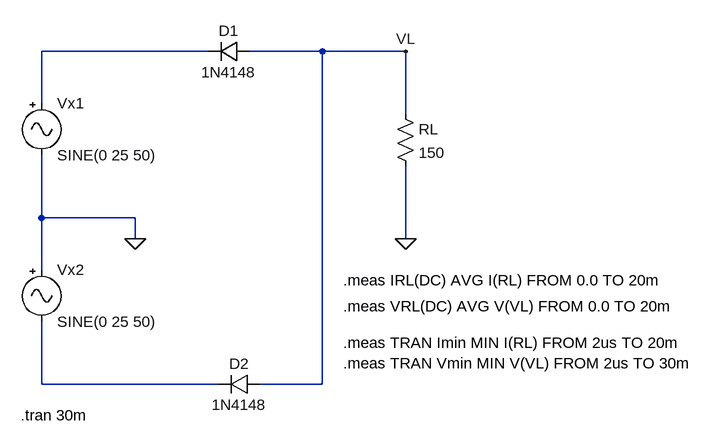
[diagram p0: schematic EXP1.4.asc]
EXP1.4.asc, the LTspice schematic file:
Version 4
SHEET 1 1104 680
WIRE 320 -16 64 -16
WIRE 496 -16 384 -16
WIRE 624 -16 496 -16
WIRE 64 64 64 -16
WIRE 624 80 624 -16
WIRE 64 240 64 144
WIRE 208 240 64 240
WIRE 208 272 208 240
WIRE 624 272 624 160
WIRE 64 320 64 240
WIRE 64 496 64 400
WIRE 336 496 64 496
WIRE 496 496 496 -16
WIRE 496 496 400 496
FLAG 208 272 0
FLAG 624 272 0
FLAG 624 -16 VL
SYMBOL Misc\\signal 64 48 R0
SYMATTR InstName Vx1
SYMATTR Value SINE(0 25 50)
SYMBOL Misc\\signal 64 304 R0
SYMATTR InstName Vx2
SYMATTR Value SINE(0 25 50)
SYMBOL diode 384 -32 R90
WINDOW 0 0 32 VBottom 2
WINDOW 3 32 32 VTop 2
SYMATTR InstName D1
SYMATTR Value 1N4148
SYMBOL diode 400 480 R90
WINDOW 0 0 32 VBottom 2
WINDOW 3 32 32 VTop 2
SYMATTR InstName D2
SYMATTR Value 1N4148
SYMBOL res 608 64 R0
SYMATTR InstName RL
SYMATTR Value 150
TEXT 528 336 Left 2 !.meas IRL(DC) AVG I(RL) FROM 0.0 TO 20m
TEXT 528 376 Left 2 !.meas VRL(DC) AVG V(VL) FROM 0.0 TO 20m
TEXT 528 432 Left 2 !.meas TRAN Imin MIN I(RL) FROM 2us TO 20m
TEXT 528 464 Left 2 !.meas TRAN Vmin MIN V(VL) FROM 2us TO 30m
TEXT 32 544 Left 2 !.tran 30m

The netlist it stands for:
* EXP1.4.asc
Vx1 N001 0 SINE(0 25 50)
Vx2 0 N002 SINE(0 25 50)
D1 VL N001 1N4148
D2 VL N002 1N4148
RL VL 0 150
.model D D
.lib standard.dio
.meas IRL(DC) AVG I(RL) FROM 0.0 TO 20m
.meas VRL(DC) AVG V(VL) FROM 0.0 TO 20m
.meas TRAN Imin MIN I(RL) FROM 2us TO 20m
.meas TRAN Vmin MIN V(VL) FROM 2us TO 30m
.tran 30m
.backanno
.end